# Altium schematic sheet CAN-Transceiver-Sheet.SchDoc
size A4; SheetNumber: 7; SheetTotal: 10
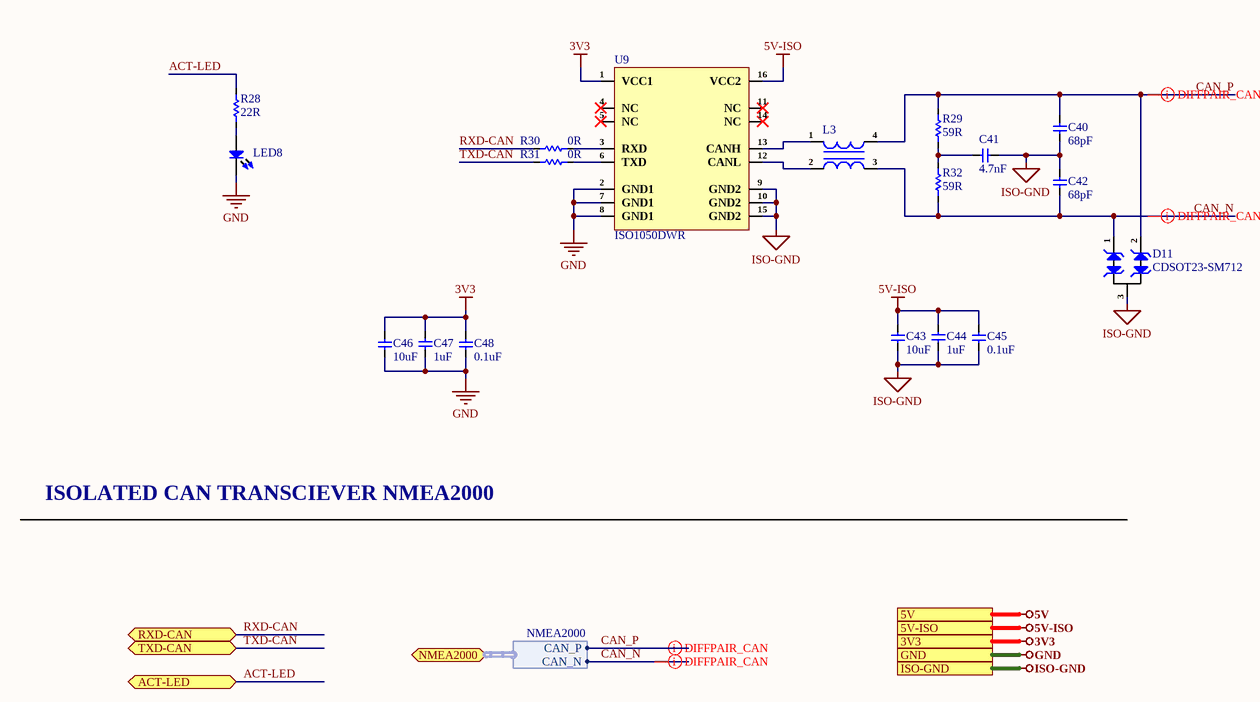
[diagram p0: CAN-Transceiver-Sheet.SchDoc]

## Parts
C40  68pF  [Cap-0603]
C41  4.7nF  [Cap-0603]
C42  68pF  [Cap-0603]
C43  10uF  [Cap-0402]
C44  1uF  [Cap-0402]
C45  0.1uF  [Cap-0402]
C46  10uF  [Cap-0402]
C47  1uF  [Cap-0402]
C48  0.1uF  [Cap-0402]
D11  CDSOT23-SM712  [SOT-23]
L3  ACT45B-510-2P-TL003  [ACT45B-510-2P-TL003]  (value not drawn)
LED8  Blue  [LED-0603]  (value not drawn)
R28  22R  [Res-0603]
R29  59R  [Res-1206]
R30  0R  [Res-0402]
R31  0R  [Res-0402]
R32  59R  [Res-1206]
U9  ISO1050DWR  [SOIC-16-300mil]

## Ports
3V3 (see Top-Sheet[3B], Controller-Sheet[3D], Fuel-Sensor-Sheet[4C], Power-Sheet-2[3D], Storage-Sheet[3D], Tank-Level-Sensor-Sheet[3D], USB-to-UART-Sheet[3D]), 5V (see Top-Sheet[3B], Connector-Sheet[3D], Fuel-Sensor-Sheet[4C], Power-Sheet-1[3D], Power-Sheet-2[3D]), 5V-ISO (see Top-Sheet[3B], Power-Sheet-2[3D]), ACT-LED (bidir, see Top-Sheet[3B]), GND (see Top-Sheet[3A], Connector-Sheet[3D], Controller-Sheet[3D], Fuel-Sensor-Sheet[4C], Power-Sheet-1[3D], Power-Sheet-2[3D], Storage-Sheet[3D], Tank-Level-Sensor-Sheet[3D], USB-to-UART-Sheet[3D]), ISO-GND (see Top-Sheet[3A], Connector-Sheet[3D], Power-Sheet-2[3D]), NMEA2000 (bidir, harness NMEA2000, see Top-Sheet[4B], Connector-Sheet[3D]), RXD-CAN (bidir, see Top-Sheet[3B]), TXD-CAN (bidir, see Top-Sheet[3B])

## Harnesses
NMEA2000: CAN_P, CAN_N

## Nets
3V3: C46.2 C47.1 C48.2 U9.1(VCC1) ; port 3V3
5V: port 5V
5V-ISO: C43.2 C44.1 C45.2 U9.16(VCC2) ; port 5V-ISO
GND: C46.1 C47.2 C48.1 LED8.2 U9.2(GND1) U9.7(GND1) U9.8(GND1) ; port GND
ISO-GND: C40.1 C41.2 C42.2 C43.1 C44.2 C45.1 D11.3(K) U9.9(GND2) U9.10(GND2) U9.15(GND2) ; port ISO-GND
ACT-LED: R28.2 ; port ACT-LED
CAN_N: C42.1 D11.1(K) L3.3 R32.1 ; port NMEA2000.CAN_N
CAN_P: C40.2 D11.2(K) L3.4 R29.2 ; port NMEA2000.CAN_P
RXD-CAN: R30.1 ; port RXD-CAN
TXD-CAN: R31.1 ; port TXD-CAN
NetC41_1: C41.1 R29.1 R32.2
NetL3_1: L3.1 U9.13(CANH)
NetL3_2: L3.2 U9.12(CANL)
NetLED8_1: LED8.1 R28.1
NetR30_2: R30.2 U9.3(RXD)
NetR31_2: R31.2 U9.6(TXD)

Not connected (* = marked no-connect by the designer): U9 4(NC)* 5(NC)* 11(NC)* 14(NC)*

## Layout directives
differential pair; net class CAN; differential pair class CAN_Lines: CAN_N, CAN_P

## Notes on the sheet
- ISOLATED CAN TRANSCIEVER NMEA2000
- File:
- Title:
- Date:
- Page
- Num:
- Total:
- Drawn By: Huzaifa Ali

## Library data of the parts
C40 C42 = CGA3E2C0G2A680JT0Y0N: CAP CER 68PF 100V C0G 0603; Manufacturer: CGA3E2C0G2A680J080AA; Item Type: Capacitor; Manufacturer Part Number: CGA3E2C0G2A680JT0Y0N; Package: 0603; LCSC Part Number: C694224
C41 = CC0603JRNPO9BN472: CAP CER 4700PF 50V C0G/NPO 0603; Manufacturer: Yageo; Item Type: Capacitor; Supplier 1: Digi-Key; Manufacturer Part Number: CC0603JRNPO9BN472; RoHS: Yes; Category: Ceramic Capacitors; Stock 1: 31779; Pricing 1: 1=0.48000, 10=0.33000, 50=0.23100, 100=0.19800, 500=0.14854, 1000=0.12543 (USD); RoHS Compliant: Yes; Supplier Part Number 1: 13-CC0603JRNPO9BN472CT-ND; LCSC Part Number: C576818; ComponentLink1Description: LCSC; ComponentLink1URL: https://www.lcsc.com/product-detail/Multilayer-Ceramic-Capacitors-MLCC-SMD-SMT_YAGEO-CC0603JRNPO9BN472_C576818.html
C43 C46 = CC0402MRX5R6BB106: CAP CER 10UF 10V X5R 0402; Manufacturer: Yageo; Tolerance: 20%; Item Type: Capacitor; Supplier 1: Future Electronics; Manufacturer Part Number: CC0402MRX5R6BB106; RoHS: Yes; Category: Ceramic Capacitors; Stock 1: 80000; Pricing 1: 10000=0.02650, 20000=0.02590, 30000=0.02550, 40000=0.02530, 50000=0.02450 (USD); Mount: Surface Mount; Case/Package: 0402; Case Code (Imperial): 0402; Case Code (Metric): 1005; Min Operating Temperature: -55°C; Max Operating Temperature: 85°C; Packaging: Tape and Reel; Capacitance: 10uF; Voltage Rating: 10V; RoHS Compliant: Yes; ComponentLink1URL: http://www.yageo.com/documents/recent/UPY-GPHC_X5R_4V-to-50V_25.pdf?src-supplier=Digi-Key; ComponentLink1Description: http://www.yageo.com/documents/recent/UPY-GPHC_X5R_4V-to-50V_25.pdf?src-supplier=Digi-Key; Supplier Part Number 1: 6097631; LCSC Part Number: C962143
C44 C47 = CL05A105KA5NQNC: CAP CER 1UF 25V X5R 0402; Manufacturer: Samsung; Material: Ceramic; Tolerance: 10%; Item Type: Capacitor; Supplier 1: Arrow Electronics; Manufacturer Part Number: CL05A105KA5NQNC; RoHS: Yes; Category: Ceramic Capacitors; Stock 1: 80000; Pricing 1: 10000=0.0256, 20000=0.0238, 30000=0.0228, 50000=0.0207, 100000=0.0175, 250000=0.0157 (USD); Mounting Technology: Surface Mount; Case/Package: 0402; Case Code (Metric): 1005; Case Code (Imperial): 0402; Min Operating Temperature: -55°C; Max Operating Temperature: 85°C; Package Quantity: 10000; Series: CL; Voltage Rating: 25V; Packaging: Tape and Reel; Construction: Flat; Value: 1uF; Dielectric: X5R; Length: 1mm; Width: 0.02inch; Height: 0.5mm; Depth: 0.5mm; Thickness: 0.022inch; Radiation Hardening: No; Lead Free: Lead Free; RoHS Compliant: Yes; ComponentLink1URL: https://datasheet.ciiva.com/25720/cl05a105ka5nqnc-25720771.pdf?src-supplier=Digi-Key; ComponentLink1Description: https://datasheet.ciiva.com/25720/cl05a105ka5nqnc-25720771.pdf?src-supplier=Digi-Key; ComponentLink2URL: https://datasheet.ciiva.com/3777/cl05a105ka5nqnc-3777709.pdf?src-supplier=Arrow+Electronics; ComponentLink2Description: https://datasheet.ciiva.com/3777/cl05a105ka5nqnc-3777709.pdf?src-supplier=Arrow+Electronics; ComponentLink3URL: https://datasheet.ciiva.com/29198/459147-da-01-en-vs-kondensator-0402-29198339.pdf?src-supplier=Conrad; ComponentLink3Description: https://datasheet.ciiva.com/29198/459147-da-01-en-vs-kondensator-0402-29198339.pdf?src-supplier=Conrad; Supplier Part Number 1: CL05A105KA5NQNC; LCSC Part Number: C52923
C45 C48 = CL05B104KB54PNC: CAP CER 0.1UF 50V X7R 0402; Manufacturer: Samsung; Supplier 1: Digi-Key; Manufacturer Part Number: CL05B104KB54PNC; Stock 1: 8594; Pricing 1: 1=0.1, 10=0.067, 50=0.0366, 100=0.0299, 500=0.02138, 1000=0.01681, 2500=0.01528, 5000=0.01406 (USD); Supplier Part Number 1: 1276-CL05B104KB54PNCDKR-ND; LCSC Part Number: C307331
D11 = CDSOT23-SM712: TVS DIODE 7V/12V 14V/26V SOT23-3; Manufacturer: Bourns; Direction: Bidirectional; Value: 75pF; Max Surge Current: 30A; Polarity: Bidirectional,Unidirectional; Number of Channels: 2; Breakdown Voltage: 13.3V; Clamping Voltage: 19V; Working Voltage: 12V; Min Breakdown Voltage: 7.5V; Power Line Protection: No; Leakage Current: 20uA; Peak Pulse Current: 17A; Diode Type: ZENER; Max Power Dissipation: 600W; Peak Pulse Power: 400W; ESD Protection: Yes; Test Current: 1mA; Item Type: Surge Protection (TVS/ESD); Supplier: Rs; Supplier Part Number: 7673728P; Manufacturer Part Number: CDSOT23-SM712; RoHS: Yes; Category: TVS Diodes; Stock: 89660; Pricing: 100=0.935, 1500=0.651, 3000=0.565, 6000=0.553 (GBP); Mounting Technology: Surface Mount; Case/Package: SOT-23; Pins: 3; Contact Plating: Tin; Min Operating Temperature: -55°C; Max Operating Temperature: 150°C; Packaging: Tape and Reel; Series: -; Termination: SMD/SMT; Reverse Standoff Voltage: 12V; Number of Elements: 2; Reverse Breakdown Voltage: 13.3V; Number of Bidirectional Channels: 2; Power Dissipation: 400W; Max Reverse Leakage Current: 20uA; Max Breakdown Voltage: 13.3V; Length: 3.04mm; Width: 0.055inch; Height: 1.11mm; Depth: 1.4mm; Radiation Hardening: No; Reach SVHC Compliant: No; RoHS Compliant: Yes; ComponentLink1URL: https://datasheet.ciiva.com/1281/1670933-1281331.pdf?src-supplier=Farnell; ComponentLink1Description: https://datasheet.ciiva.com/1281/1670933-1281331.pdf?src-supplier=Farnell; ComponentLink2URL: https://datasheet.ciiva.com/4510/cdsot23-sm712-25932-4510261.pdf?src-supplier=Mouser; ComponentLink2Description: https://datasheet.ciiva.com/4510/cdsot23-sm712-25932-4510261.pdf?src-supplier=Mouser; ComponentLink3URL: https://datasheet.ciiva.com/11193/cdsot23-sm712-11193846.pdf?src-supplier=Avnet; ComponentLink3Description: https://datasheet.ciiva.com/11193/cdsot23-sm712-11193846.pdf?src-supplier=Avnet; ComponentLink4URL: https://datasheet.ciiva.com/22696/1670933-22696779.pdf?src-supplier=Element14; ComponentLink4Description: https://datasheet.ciiva.com/22696/1670933-22696779.pdf?src-supplier=Element14; ComponentLink5URL: https://datasheet.ciiva.com/26828/getdatasheetpartid-418501-26828522.pdf?src-supplier=Verical; ComponentLink5Description: https://datasheet.ciiva.com/26828/getdatasheetpartid-418501-26828522.pdf?src-supplier=Verical; ComponentLink6URL: https://datasheet.ciiva.com/337/cdsot23-sm712-337451.pdf?src-supplier=Digikey; ComponentLink6Description: https://datasheet.ciiva.com/337/cdsot23-sm712-337451.pdf?src-supplier=Digikey; ComponentLink7URL: https://datasheet.ciiva.com/337/cdsot23-sm712-337452.pdf?src-supplier=Digikey; ComponentLink7Description: https://datasheet.ciiva.com/337/cdsot23-sm712-337452.pdf?src-supplier=Digikey; LCSC Part Number: C404012
L3 = ACT45B-510-2P-TL003: CMC 51UH 200MA 2LN 2.8KOHM SMD; Manufacturer: TDK; Impedance: 2.8kR; Voltage Rating (DC): 50V; Number of Lines: 2; Tolerance: 50%; DC Resistance (DCR): 1R; Test Frequency: 10MHz; Insulation Resistance: 10MR; Item Type: Common Mode Filter; Supplier: Arrow Electronics; Supplier Part Number: ACT45B-510-2P-TL003; Manufacturer Part Number: ACT45B-510-2P-TL003; RoHS: Yes; Category: Fixed Inductors; Stock: 390000; Pricing: 2500=0.8915, 5000=0.8612, 10000=0.8526 (USD); Mounting Technology: Surface Mount; Case/Package: 1812; Pins: 4; Case Code (Imperial): 1812; Min Operating Temperature: -40°C; Max Operating Temperature: 150°C; Packaging: Tape and Reel; Value: 51uH; Current Rating: 200mA; Package Quantity: 2000; Voltage Rating: 50V; Max DC Current: 200mA; Termination: SMD/SMT; DC Current: 200mA; Series: ACT; DC Resistance-Max: 1R; Max Current Rating: 200mA; Length: 4.5mm; Width: 3.2mm; Height: 3mm; Depth: 3.4mm; Ratings: AEC-Q200; Radiation Hardening: No; Reach SVHC Compliant: No; Military Standard: Not; RoHS Compliant: Yes; Lead Free: 5697LeadFree; ComponentLink1URL: https://datasheet.ciiva.com/22726/1649098-22726290.pdf?src-supplier=Element14; ComponentLink1Description: https://datasheet.ciiva.com/22726/1649098-22726290.pdf?src-supplier=Element14; ComponentLink2URL: https://datasheet.ciiva.com/1007/e9711-act-1007931.pdf?src-supplier=Digikey; ComponentLink2Description: https://datasheet.ciiva.com/1007/e9711-act-1007931.pdf?src-supplier=Digikey; ComponentLink3URL: https://datasheet.ciiva.com/1007/e9711-act-1007933.pdf?src-supplier=Digikey; ComponentLink3Description: https://datasheet.ciiva.com/1007/e9711-act-1007933.pdf?src-supplier=Digikey; ComponentLink4URL: https://datasheet.ciiva.com/8498/e9711-act-8498633.pdf?src-supplier=Avnet; ComponentLink4Description: https://datasheet.ciiva.com/8498/e9711-act-8498633.pdf?src-supplier=Avnet; ComponentLink5URL: https://datasheet.ciiva.com/7649/1833202-7649183.pdf?src-supplier=Element14; ComponentLink5Description: https://datasheet.ciiva.com/7649/1833202-7649183.pdf?src-supplier=Element14; ComponentLink6URL: https://datasheet.ciiva.com/1007/e9711-act-1007932.pdf?src-supplier=Digikey; ComponentLink6Description: https://datasheet.ciiva.com/1007/e9711-act-1007932.pdf?src-supplier=Digikey; ComponentLink7URL: https://datasheet.ciiva.com/15191/getdatasheetpartid-349822-15191803.pdf?src-supplier=Verical; ComponentLink7Description: https://datasheet.ciiva.com/15191/getdatasheetpartid-349822-15191803.pdf?src-supplier=Verical; LCSC Part Number: C76584
LED8 = NCD0603B3: blue 0603 Light Emitting Diodes (LED) ROHS; Manufacturer: Foshan NationStar Optoelectronics; Manufacturer Part Number: NCD0603B3; Package: 0603; LCSC Part Number: C158101; Item Type: LED; ComponentLink1Description: LCSC; ComponentLink1URL: https://www.lcsc.com/product-detail/Light-Emitting-Diodes-LED_Foshan-NationStar-Optoelectronics-NCD0603B3_C158101.html
R28 = RC0603FR-0722RL: RES 22 OHM 1% 1/10W 0603; Manufacturer: Yageo; Voltage Rating: 50V; Power Rating: 100mW; Temperature Coefficient: 100ppm/°C; Item Type: Resistor; Supplier 1: Avnet; Manufacturer Part Number: RC0603FR-0722RL; RoHS: Yes; Category: Chip SMD Resistors; Stock 1: 190000; Pricing 1: 5000=0.00133, 10000=0.00131, 20000=0.00127 (USD); Case/Package: 0603; Number of Pins: 2; Case Code (Imperial): 0603; Case Code (Metric): 1608; Size Code: 0603; Min Operating Temperature: -55°C; Max Operating Temperature: 155°C; Resistor Type: Thick Film; Voltage Rating (DC): 50V; Resistance: 22R; Tolerance: 1%; Packaging: Tape and Reel; Termination: SMD/SMT; Features: Moisture Resistant; Series: RC; Max Power Dissipation: 100mW; Number of Terminations: 2; Resistance Tolerance: 1%; Technology: THICK FILM; Construction: Rectangular; Length: 0.063inch; Width: 0.031inch; Height: 0.022inch; Depth: 0.8mm; RoHS Compliant: Yes; Reach SVHC Compliant: Yes; Military Standard: Not; Lead Free: Lead Free; ComponentLink1URL: https://datasheet.ciiva.com/11819/0900766b80f96399-11819285.pdf?src-supplier=RSComponents; ComponentLink1Description: https://datasheet.ciiva.com/11819/0900766b80f96399-11819285.pdf?src-supplier=RSComponents; ComponentLink2URL: https://datasheet.ciiva.com/46395/443971-46395032.pdf?src-supplier=Element14; ComponentLink2Description: https://datasheet.ciiva.com/46395/443971-46395032.pdf?src-supplier=Element14; ComponentLink3URL: https://datasheet.ciiva.com/46440/1868787-46440901.pdf?src-supplier=Element14; ComponentLink3Description: https://datasheet.ciiva.com/46440/1868787-46440901.pdf?src-supplier=Element14; ComponentLink4URL: https://datasheet.ciiva.com/2454/pyu-r-int-thick-7-2454355.pdf?src-supplier=Digi-Key; ComponentLink4Description: https://datasheet.ciiva.com/2454/pyu-r-int-thick-7-2454355.pdf?src-supplier=Digi-Key; ComponentLink5URL: https://datasheet.ciiva.com/2454/pyu-r-int-thick-7-2454356.pdf?src-supplier=Digi-Key; ComponentLink5Description: https://datasheet.ciiva.com/2454/pyu-r-int-thick-7-2454356.pdf?src-supplier=Digi-Key; Supplier Part Number 1: RC0603FR-0722RL; LCSC Part Number: C107701; Package Quantity: 1; ComponentLink6URL: https://datasheet.ciiva.com/2454/pyu-r-int-thick-7-2454354.pdf?src-supplier=Digi-Key; ComponentLink6Description: https://datasheet.ciiva.com/2454/pyu-r-int-thick-7-2454354.pdf?src-supplier=Digi-Key
R29 R32 = RT1206BRD0759RL: RES SMD 59 OHM 0.1% 1/4W 1206; Manufacturer: Yageo; Voltage Rating: 200V; Power Rating: 250mW; Temperature Coefficient: 25ppm/°C; Item Type: Resistor; Supplier: Digikey; Supplier Part Number: RT1206BRD0759RL-ND; Manufacturer Part Number: RT1206BRD0759RL; RoHS: Yes; Category: Chip SMD Resistors; Pricing: 5000=0.09403 (USD); Case/Package: 1206; Case Code (Metric): 3216; Case Code (Imperial): 1206; Min Operating Temperature: -55°C; Max Operating Temperature: 125°C; Value: 59R; Tolerance: 0.1%; Packaging: Tape and Reel; Package Quantity: 5000; Termination: SMD/SMT; Number of Terminations: 2; Max Power Dissipation: 250mW; Voltage Rating (DC): 200V; Series: RT; Length: 0.122inch; Width: 0.063inch; Height: 0.026inch; Lead Free: Lead Free; RoHS Compliant: Yes; ComponentLink1URL: https://datasheet.ciiva.com/12704/pyu-rt-1-to-0-05-rohs-l-4-12704681.pdf?src-supplier=Mouser; ComponentLink1Description: https://datasheet.ciiva.com/12704/pyu-rt-1-to-0-05-rohs-l-4-12704681.pdf?src-supplier=Mouser; ComponentLink2URL: https://datasheet.ciiva.com/2587/pyu-rt-1-to-0-05-rohs-l-5-2587786.pdf?src-supplier=Digikey; ComponentLink2Description: https://datasheet.ciiva.com/2587/pyu-rt-1-to-0-05-rohs-l-5-2587786.pdf?src-supplier=Digikey; LCSC Part Number: C870810
R30 R31 = RC0402FR-070RL: RES 0 OHM JUMPER 1/16W 0402; Manufacturer: Yageo; Tolerance: 1%; Power Rating: 62.5mW; Voltage Rating: 50V; Temperature Coefficient: 200ppm/°C; Max Power Dissipation: 63mW; Supplier 1: Mouser; Manufacturer Part Number: RC0402FR-070RL; RoHS: Yes; Category: Chip SMD Resistors; Stock 1: 8556842; Pricing 1: 1=0.10000, 10=0.01400, 50=0.01400, 100=0.00600, 1000=0.00300, 5000=0.00200, 10000=0.00100 (USD); Mount: Surface Mount; Case/Package: 0402; Contact Plating: Tin,Matte; Case Code (Imperial): 0402; Case Code (Metric): 1005; Size Code: 0402; Min Operating Temperature: -55°C; Max Operating Temperature: 155°C; Resistance: 0R; Resistor Type: Thick Film; Packaging: Tape and Reel; Termination: SMD/SMT; Features: Moisture Resistant; Series: RC; Number of Terminations: 2; Length: 1mm; Width: 0.5mm; Height: 0.35mm; Radiation Hardening: No; Lead Free: Lead Free; RoHS Compliant: Yes; ComponentLink1URL: https://datasheet.ciiva.com/8896/pyu-rc0402-51-rohs-l-6-8896149.pdf?src-supplier=Avnet; ComponentLink1Description: https://datasheet.ciiva.com/8896/pyu-rc0402-51-rohs-l-6-8896149.pdf?src-supplier=Avnet; ComponentLink2URL: https://datasheet.ciiva.com/16790/pyu-rc0402-51-rohs-l-6-r-16790444.pdf?src-supplier=Future+Electronics; ComponentLink2Description: https://datasheet.ciiva.com/16790/pyu-rc0402-51-rohs-l-6-r-16790444.pdf?src-supplier=Future+Electronics; Supplier Part Number 1: 603-RC0402FR-070RL; LCSC Part Number: C106231
U9 = ISO1050DWR: 1/1 Transceiver Half CAN 16-SOIC; Manufacturer: Texas Instruments; Data Rate: 1Mbps; Max Supply Voltage: 5.5V; Min Supply Voltage: 3V; Propagation Delay: 74ns; Number of Channels: 2; Number of Transceivers: 1; Simplex/Duplex: Half Duplex; Receiver Hysteresis: 150mV; Working Voltage: 1.2V; Supply Current: 2mA; Supplier: Mouser; Supplier Part Number: 595-ISO1050DWR; Manufacturer Part Number: ISO1050DWR; RoHS: Yes; Category: Interface ICs; Stock: 4624; Pricing: 1=4.3, 10=3.76, 50=3.76, 100=3.17, 1000=2.37, 10000=2.26 (USD); Case/Package: SOIC; Pins: 16; Min Operating Temperature: -55°C; Max Operating Temperature: 105°C; Packaging: Tape and Reel; Package Quantity: 2000; Number of Drivers: 1; Series: -; Radiation Hardening: No; Lead Free: Lead Free; RoHS Compliant: Yes; ComponentLink1URL: https://datasheet.ciiva.com/4782/slls983e-121851-4782209.pdf?src-supplier=Mouser; ComponentLink1Description: https://datasheet.ciiva.com/4782/slls983e-121851-4782209.pdf?src-supplier=Mouser; ComponentLink2URL: https://datasheet.ciiva.com/26913/getdatasheetpartid-573378-26913111.pdf?src-supplier=Verical; ComponentLink2Description: https://datasheet.ciiva.com/26913/getdatasheetpartid-573378-26913111.pdf?src-supplier=Verical